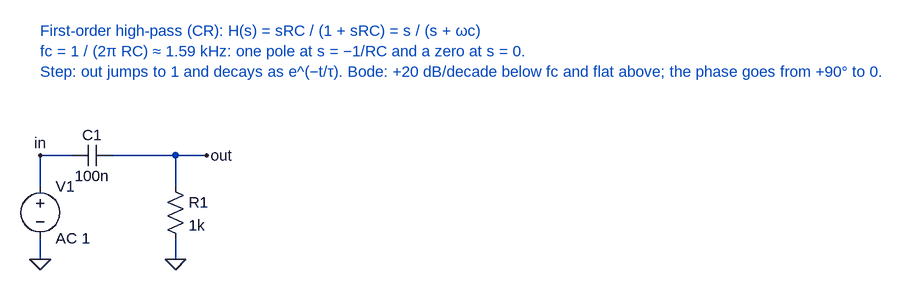
[diagram p0: schematic hp1.asc]
hp1.asc, the LTspice schematic file:
Version 4
SHEET 1 1200 800
WIRE 0 -32 48 -32
WIRE 112 -32 208 -32
WIRE 208 -32 256 -32
WIRE 208 -32 208 16
WIRE 208 96 208 128
WIRE 0 16 0 -32
WIRE 0 96 0 128
FLAG 208 128 0
FLAG 256 -32 out
FLAG 0 128 0
FLAG 0 -32 in
SYMBOL voltage 0 0 R0
SYMATTR InstName V1
SYMATTR Value AC 1
SYMBOL cap 112 -48 R90
WINDOW 0 0 32 VBottom 2
WINDOW 3 32 32 VTop 2
SYMATTR InstName C1
SYMATTR Value 100n
SYMBOL res 192 0 R0
SYMATTR InstName R1
SYMATTR Value 1k
TEXT 0 -224 Left 2 ;First-order high-pass (CR): H(s) = sRC / (1 + sRC) = s / (s + ωc)\nfc = 1 / (2π RC) ≈ 1.59 kHz: one pole at s = −1/RC and a zero at s = 0.\nStep: out jumps to 1 and decays as e^(−t/τ). Bode: +20 dB/decade below fc and flat above; the phase goes from +90° to 0.

The netlist it stands for:
* hp1.asc
V1 in 0 AC 1
C1 out in 100n
R1 out 0 1k
* First-order high-pass (CR): H(s) = sRC / (1 + sRC) = s / (s + ωc)
* fc = 1 / (2π RC) ≈ 1.59 kHz: one pole at s = −1/RC and a zero at s = 0.
* Step: out jumps to 1 and decays as e^(−t/τ). Bode: +20 dB/decade below fc and flat above; the phase goes from +90° to 0.
.backanno
.end